# Altium project Deck Versal.PrjPcb
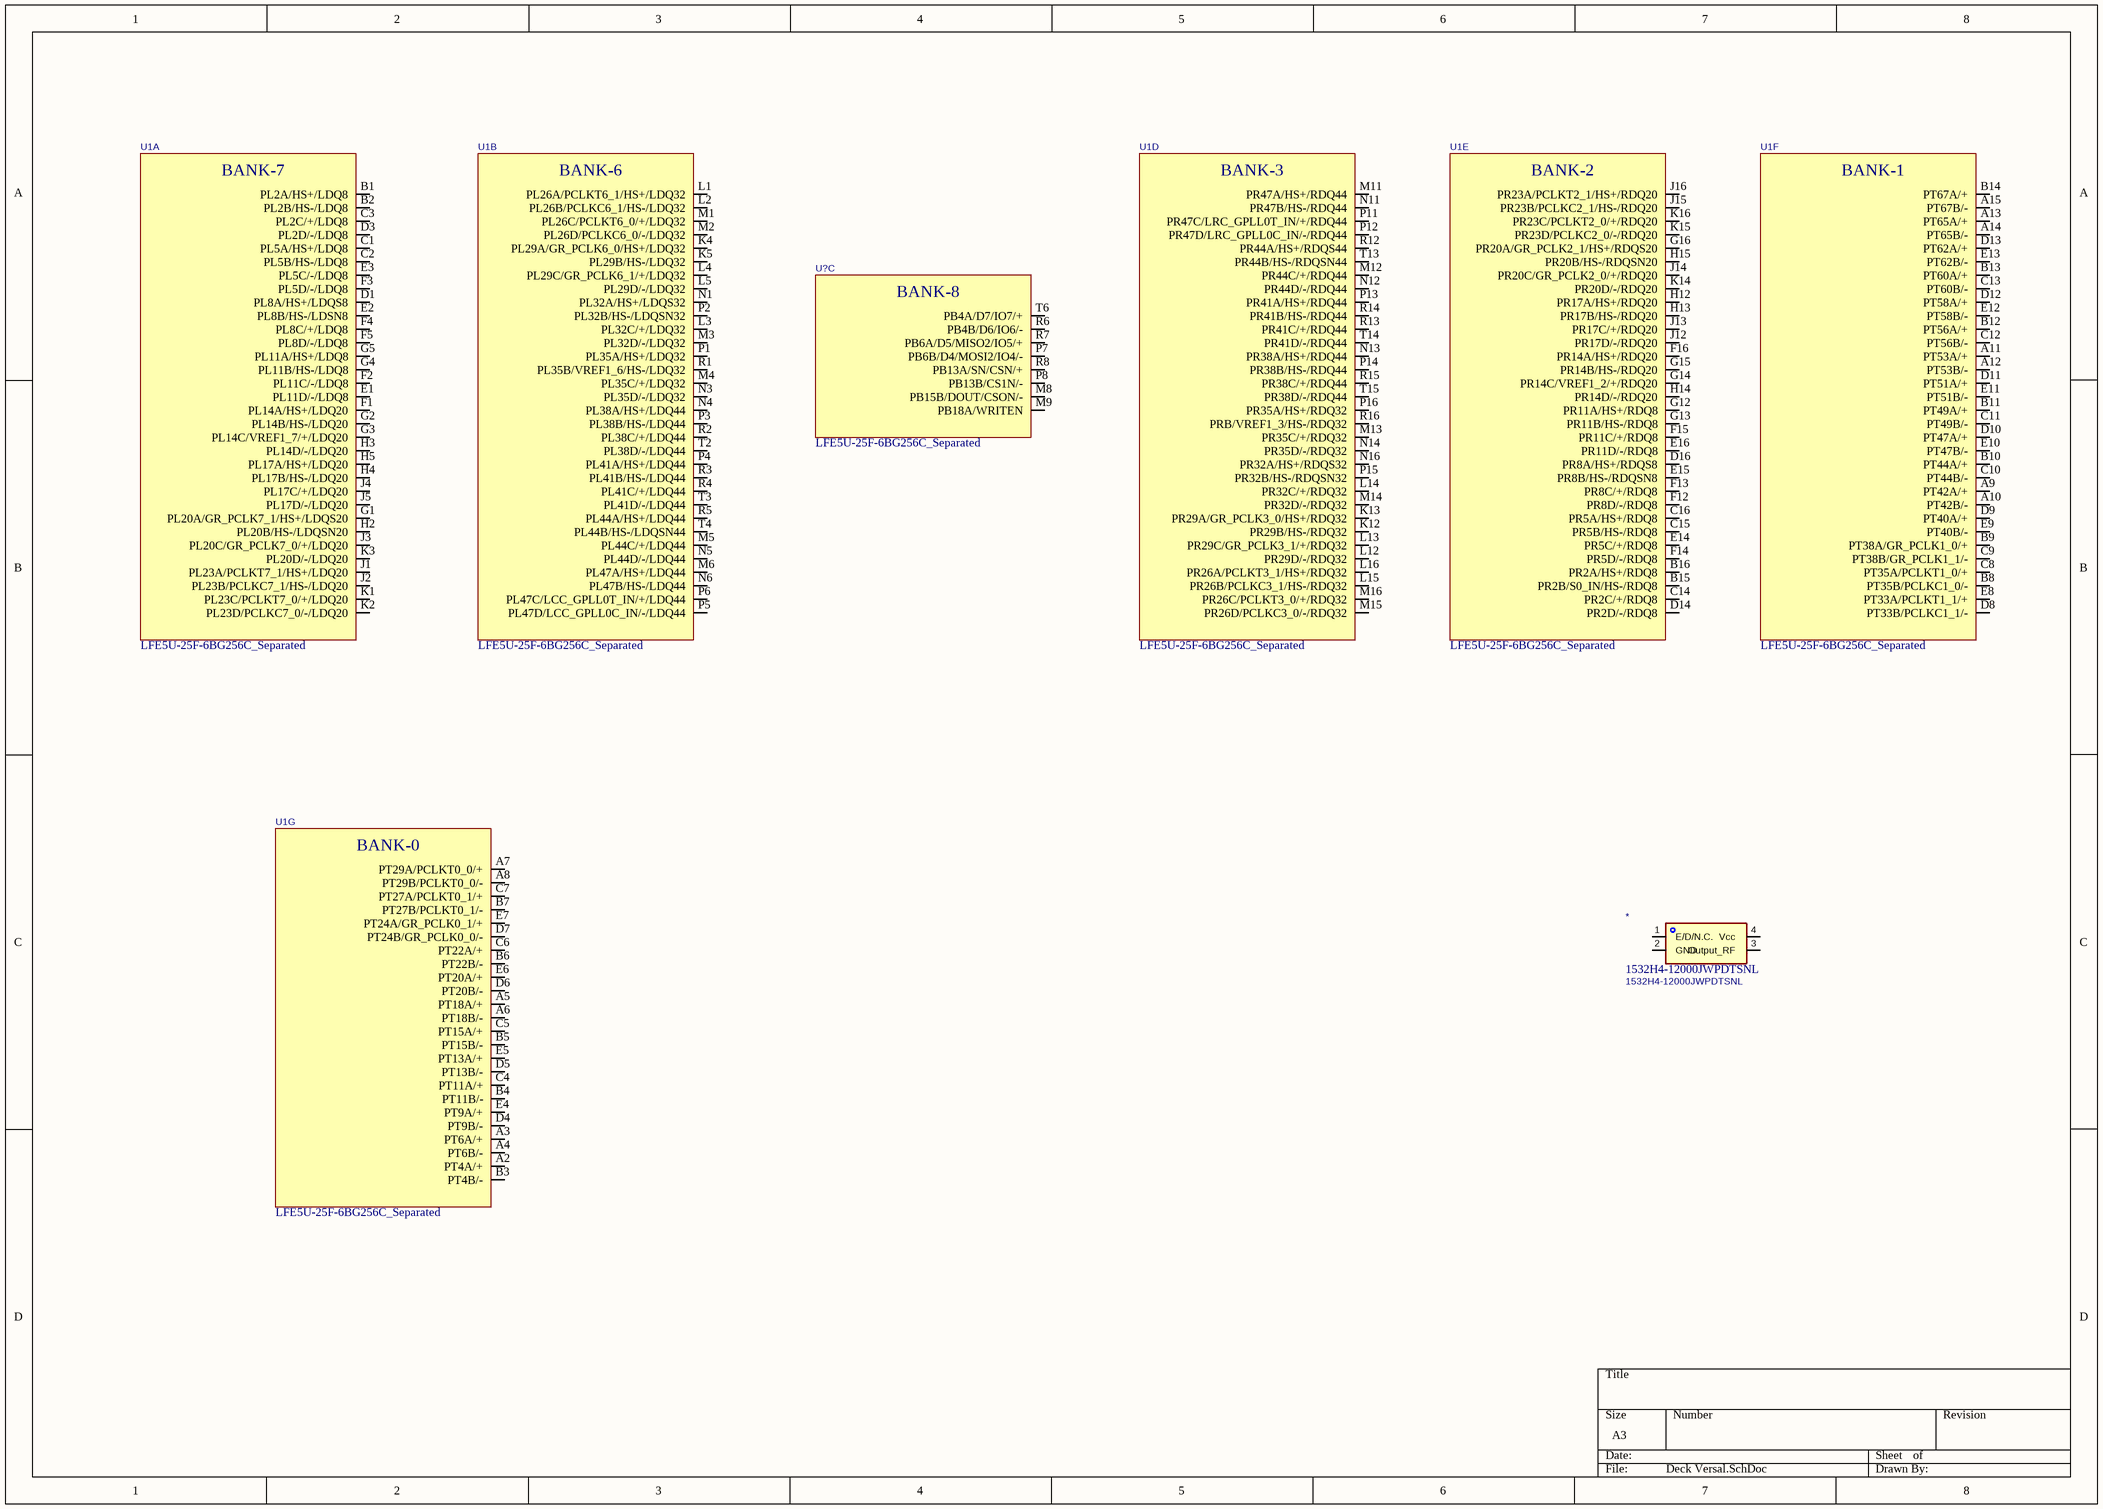
[diagram p0: Deck Versal.SchDoc]
5 sheets, 176 parts. Net scope: global (net labels, ports and power ports of the same name join across sheets).
Board file: Deck Versal.PcbDoc
Sheets:
  Deck Versal.SchDoc
  Keyboard.SchDoc
  Memory.SchDoc
  Peripherals.SchDoc
  Power.SchDoc

## Sheet Deck Versal.SchDoc
size A3

### Parts
(Parts that share a designator on the sheet are numbered #1, #2 ... from top to bottom, then left to right.)
*#1  1532H4-12000JWPDTSNL  [OSC-SMD_4P-L3.2-W2.5-BL]
U1  LFE5U-25F-6BG256C_Separated  [CABGA-256_L14.0-W14.0-R16-C16-P0.80-TL]  (parts A,B,D,E,F,G of 8)
U?  LFE5U-25F-6BG256C_Separated  [CABGA-256_L14.0-W14.0-R16-C16-P0.80-TL]  (part C of 8)

### Nets

Not connected (* = marked no-connect by the designer): *#1 1(E/D/N.C.) 2(GND) 3(Output_RF) 4(Vcc); U1 A2(PT4A/+) A3(PT6A/+) A4(PT6B/-) A5(PT18A/+) A6(PT18B/-) A7(PT29A/PCLKT0_0/+) A8(PT29B/PCLKT0_0/-) A9(PT42A/+) A10(PT42B/-) A11(PT53A/+) A12(PT53B/-) A13(PT65A/+) A14(PT65B/-) A15(PT67B/-) B1(PL2A/HS+/LDQ8) B2(PL2B/HS-/LDQ8) B3(PT4B/-) B4(PT11B/-) B5(PT15B/-) B6(PT22B/-) B7(PT27B/PCLKT0_1/-) B8(PT35B/PCLKC1_0/-) B9(PT38A/GR_PCLK1_0/+) B10(PT44A/+) B11(PT49A/+) B12(PT56A/+) B13(PT60A/+) B14(PT67A/+) B15(PR2B/S0_IN/HS-/RDQ8) B16(PR2A/HS+/RDQ8) C1(PL5A/HS+/LDQ8) C2(PL5B/HS-/LDQ8) C3(PL2C/+/LDQ8) C4(PT11A/+) C5(PT15A/+) C6(PT22A/+) C7(PT27A/PCLKT0_1/+) C8(PT35A/PCLKT1_0/+) C9(PT38B/GR_PCLK1_1/-) C10(PT44B/-) C11(PT49B/-) C12(PT56B/-) C13(PT60B/-) C14(PR2C/+/RDQ8) C15(PR5B/HS-/RDQ8) C16(PR5A/HS+/RDQ8) D1(PL8A/HS+/LDQS8) D3(PL2D/-/LDQ8) D4(PT9B/-) D5(PT13B/-) D6(PT20B/-) D7(PT24B/GR_PCLK0_0/-) D8(PT33B/PCLKC1_1/-) D9(PT40A/+) D10(PT47A/+) D11(PT51A/+) D12(PT58A/+) D13(PT62A/+) D14(PR2D/-/RDQ8) D16(PR8A/HS+/RDQS8) E1(PL11D/-/LDQ8) E2(PL8B/HS-/LDSN8) E3(PL5C/-/LDQ8) E4(PT9A/+) E5(PT13A/+) E6(PT20A/+) E7(PT24A/GR_PCLK0_1/+) E8(PT33A/PCLKT1_1/+) E9(PT40B/-) E10(PT47B/-) E11(PT51B/-) E12(PT58B/-) E13(PT62B/-) E14(PR5C/+/RDQ8) E15(PR8B/HS-/RDQSN8) E16(PR11D/-/RDQ8) F1(PL14A/HS+/LDQ20) F2(PL11C/-/LDQ8) F3(PL5D/-/LDQ8) F4(PL8C/+/LDQ8) F5(PL8D/-/LDQ8) F12(PR8D/-/RDQ8) F13(PR8C/+/RDQ8) F14(PR5D/-/RDQ8) F15(PR11C/+/RDQ8) F16(PR14A/HS+/RDQ20) G1(PL20A/GR_PCLK7_1/HS+/LDQS20) G2(PL14B/HS-/LDQ20) G3(PL14C/VREF1_7/+/LDQ20) G4(PL11B/HS-/LDQ8) G5(PL11A/HS+/LDQ8) G12(PR11A/HS+/RDQ8) G13(PR11B/HS-/RDQ8) G14(PR14C/VREF1_2/+/RDQ20) G15(PR14B/HS-/RDQ20) G16(PR20A/GR_PCLK2_1/HS+/RDQS20) H2(PL20B/HS-/LDQSN20) H3(PL14D/-/LDQ20) H4(PL17B/HS-/LDQ20) H5(PL17A/HS+/LDQ20) H12(PR17A/HS+/RDQ20) H13(PR17B/HS-/RDQ20) H14(PR14D/-/RDQ20) H15(PR20B/HS-/RDQSN20) J1(PL23A/PCLKT7_1/HS+/LDQ20) J2(PL23B/PCLKC7_1/HS-/LDQ20) J3(PL20C/GR_PCLK7_0/+/LDQ20) J4(PL17C/+/LDQ20) J5(PL17D/-/LDQ20) J12(PR17D/-/RDQ20) J13(PR17C/+/RDQ20) J14(PR20C/GR_PCLK2_0/+/RDQ20) J15(PR23B/PCLKC2_1/HS-/RDQ20) J16(PR23A/PCLKT2_1/HS+/RDQ20) K1(PL23C/PCLKT7_0/+/LDQ20) K2(PL23D/PCLKC7_0/-/LDQ20) K3(PL20D/-/LDQ20) K4(PL29A/GR_PCLK6_0/HS+/LDQ32) K5(PL29B/HS-/LDQ32) K12(PR29B/HS-/RDQ32) K13(PR29A/GR_PCLK3_0/HS+/RDQ32) K14(PR20D/-/RDQ20) K15(PR23D/PCLKC2_0/-/RDQ20) K16(PR23C/PCLKT2_0/+/RDQ20) L1(PL26A/PCLKT6_1/HS+/LDQ32) L2(PL26B/PCLKC6_1/HS-/LDQ32) L3(PL32C/+/LDQ32) L4(PL29C/GR_PCLK6_1/+/LDQ32) L5(PL29D/-/LDQ32) L12(PR29D/-/RDQ32) L13(PR29C/GR_PCLK3_1/+/RDQ32) L14(PR32C/+/RDQ32) L15(PR26B/PCLKC3_1/HS-/RDQ32) L16(PR26A/PCLKT3_1/HS+/RDQ32) M1(PL26C/PCLKT6_0/+/LDQ32) M2(PL26D/PCLKC6_0/-/LDQ32) M3(PL32D/-/LDQ32) M4(PL35C/+/LDQ32) M5(PL44C/+/LDQ44) M6(PL47A/HS+/LDQ44) M11(PR47A/HS+/RDQ44) M12(PR44C/+/RDQ44) M13(PR35C/+/RDQ32) M14(PR32D/-/RDQ32) M15(PR26D/PCLKC3_0/-/RDQ32) M16(PR26C/PCLKT3_0/+/RDQ32) N1(PL32A/HS+/LDQS32) N3(PL35D/-/LDQ32) N4(PL38A/HS+/LDQ44) N5(PL44D/-/LDQ44) N6(PL47B/HS-/LDQ44) N11(PR47B/HS-/RDQ44) N12(PR44D/-/RDQ44) N13(PR38A/HS+/RDQ44) N14(PR35D/-/RDQ32) N16(PR32A/HS+/RDQS32) P1(PL35A/HS+/LDQ32) P2(PL32B/HS-/LDQSN32) P3(PL38B/HS-/LDQ44) P4(PL41A/HS+/LDQ44) P5(PL47D/LCC_GPLL0C_IN/-/LDQ44) P6(PL47C/LCC_GPLL0T_IN/+/LDQ44) P11(PR47C/LRC_GPLL0T_IN/+/RDQ44) P12(PR47D/LRC_GPLL0C_IN/-/RDQ44) P13(PR41A/HS+/RDQ44) P14(PR38B/HS-/RDQ44) P15(PR32B/HS-/RDQSN32) P16(PR35A/HS+/RDQ32) R1(PL35B/VREF1_6/HS-/LDQ32) R2(PL38C/+/LDQ44) R3(PL41B/HS-/LDQ44) R4(PL41C/+/LDQ44) R5(PL44A/HS+/LDQ44) R12(PR44A/HS+/RDQS44) R13(PR41C/+/RDQ44) R14(PR41B/HS-/RDQ44) R15(PR38C/+/RDQ44) R16(PRB/VREF1_3/HS-/RDQ32) T2(PL38D/-/LDQ44) T3(PL41D/-/LDQ44) T4(PL44B/HS-/LDQSN44) T13(PR44B/HS-/RDQSN44) T14(PR41D/-/RDQ44) T15(PR38D/-/RDQ44); U? M8(PB15B/DOUT/CSON/-) M9(PB18A/WRITEN) P7(PB6B/D4/MOSI2/IO4/-) P8(PB13B/CS1N/-) R6(PB4B/D6/IO6/-) R7(PB6A/D5/MISO2/IO5/+) R8(PB13A/SN/CSN/+) T6(PB4A/D7/IO7/+)

### Notes on the sheet
- (in symbol LFE5U-25F-6BG256C_Separated, part A) BANK-7
- (in symbol LFE5U-25F-6BG256C_Separated, part B) BANK-6
- (in symbol LFE5U-25F-6BG256C_Separated, part C) BANK-8
- (in symbol LFE5U-25F-6BG256C_Separated, part D) BANK-3
- (in symbol LFE5U-25F-6BG256C_Separated, part E) BANK-2
- (in symbol LFE5U-25F-6BG256C_Separated, part F) BANK-1
- (in symbol LFE5U-25F-6BG256C_Separated, part G) BANK-0

### Library data of the parts
*#1 = 1532H4-12000JWPDTSNL: Manufacturer: HCI(杭晶); ki_keywords: Oscillators; Footprint: easyeda2kicad:OSC-SMD_4P-L3.2-W2.5-BL; Supplier: https://www.lcsc.com/datasheet/C5383163.pdf; MPN: 1532H4-12000JWPDTSNL; LCSC Part: C5383163; Value: 1532H4-12000JWPDTSNL
U1 U? = LFE5U-25F-6BG256C_Separated: Manufacturer: LATTICE(莱迪思); ki_keywords: CPLD/FPGA; Footprint: easyeda2kicad:CABGA-256_L14.0-W14.0-R16-C16-P0.80-TL; Supplier: https://www.lcsc.com/datasheet/C1521614.pdf; MPN: LFE5U-25F-6BG256C; LCSC Part: C1521614

## Sheet Keyboard.SchDoc
size C
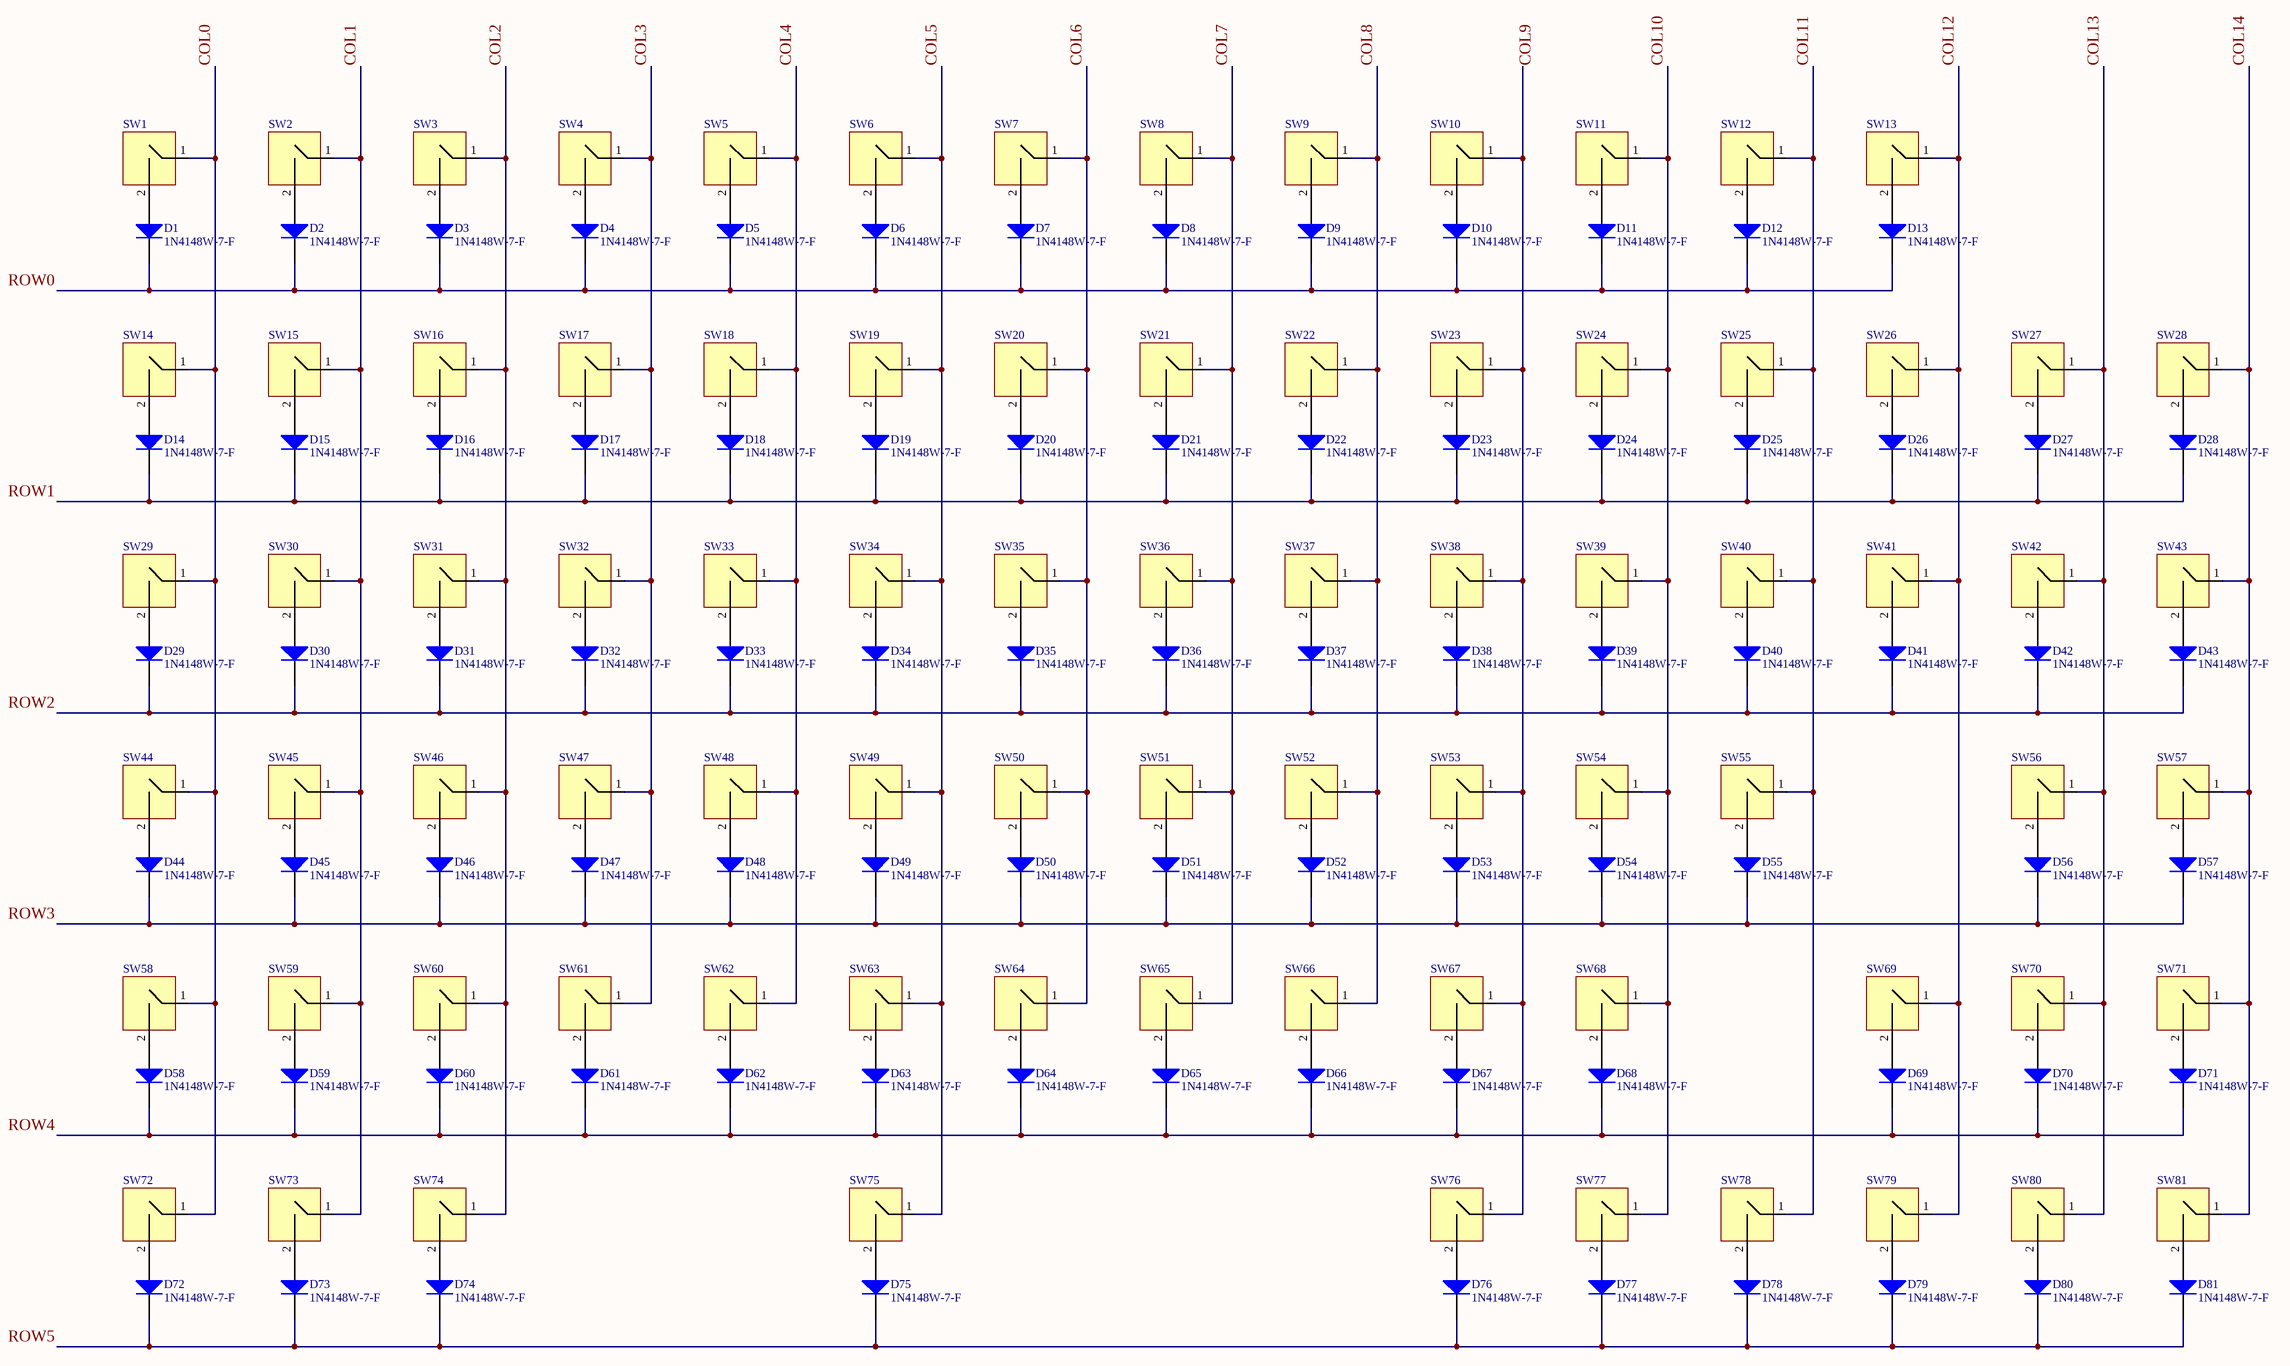
[diagram p1: Keyboard.SchDoc]

### Parts
D1  1N4148W-7-F  [DIOD-SOD123-2_V]
D2  1N4148W-7-F  [DIOD-SOD123-2_V]
D3  1N4148W-7-F  [DIOD-SOD123-2_V]
D4  1N4148W-7-F  [DIOD-SOD123-2_V]
D5  1N4148W-7-F  [DIOD-SOD123-2_V]
D6  1N4148W-7-F  [DIOD-SOD123-2_V]
D7  1N4148W-7-F  [DIOD-SOD123-2_V]
D8  1N4148W-7-F  [DIOD-SOD123-2_V]
D9  1N4148W-7-F  [DIOD-SOD123-2_V]
D10  1N4148W-7-F  [DIOD-SOD123-2_V]
D11  1N4148W-7-F  [DIOD-SOD123-2_V]
D12  1N4148W-7-F  [DIOD-SOD123-2_V]
D13  1N4148W-7-F  [DIOD-SOD123-2_V]
D14  1N4148W-7-F  [DIOD-SOD123-2_V]
D15  1N4148W-7-F  [DIOD-SOD123-2_V]
D16  1N4148W-7-F  [DIOD-SOD123-2_V]
D17  1N4148W-7-F  [DIOD-SOD123-2_V]
D18  1N4148W-7-F  [DIOD-SOD123-2_V]
D19  1N4148W-7-F  [DIOD-SOD123-2_V]
D20  1N4148W-7-F  [DIOD-SOD123-2_V]
D21  1N4148W-7-F  [DIOD-SOD123-2_V]
D22  1N4148W-7-F  [DIOD-SOD123-2_V]
D23  1N4148W-7-F  [DIOD-SOD123-2_V]
D24  1N4148W-7-F  [DIOD-SOD123-2_V]
D25  1N4148W-7-F  [DIOD-SOD123-2_V]
D26  1N4148W-7-F  [DIOD-SOD123-2_V]
D27  1N4148W-7-F  [DIOD-SOD123-2_V]
D28  1N4148W-7-F  [DIOD-SOD123-2_V]
D29  1N4148W-7-F  [DIOD-SOD123-2_V]
D30  1N4148W-7-F  [DIOD-SOD123-2_V]
D31  1N4148W-7-F  [DIOD-SOD123-2_V]
D32  1N4148W-7-F  [DIOD-SOD123-2_V]
D33  1N4148W-7-F  [DIOD-SOD123-2_V]
D34  1N4148W-7-F  [DIOD-SOD123-2_V]
D35  1N4148W-7-F  [DIOD-SOD123-2_V]
D36  1N4148W-7-F  [DIOD-SOD123-2_V]
D37  1N4148W-7-F  [DIOD-SOD123-2_V]
D38  1N4148W-7-F  [DIOD-SOD123-2_V]
D39  1N4148W-7-F  [DIOD-SOD123-2_V]
D40  1N4148W-7-F  [DIOD-SOD123-2_V]
D41  1N4148W-7-F  [DIOD-SOD123-2_V]
D42  1N4148W-7-F  [DIOD-SOD123-2_V]
D43  1N4148W-7-F  [DIOD-SOD123-2_V]
D44  1N4148W-7-F  [DIOD-SOD123-2_V]
D45  1N4148W-7-F  [DIOD-SOD123-2_V]
D46  1N4148W-7-F  [DIOD-SOD123-2_V]
D47  1N4148W-7-F  [DIOD-SOD123-2_V]
D48  1N4148W-7-F  [DIOD-SOD123-2_V]
D49  1N4148W-7-F  [DIOD-SOD123-2_V]
D50  1N4148W-7-F  [DIOD-SOD123-2_V]
D51  1N4148W-7-F  [DIOD-SOD123-2_V]
D52  1N4148W-7-F  [DIOD-SOD123-2_V]
D53  1N4148W-7-F  [DIOD-SOD123-2_V]
D54  1N4148W-7-F  [DIOD-SOD123-2_V]
D55  1N4148W-7-F  [DIOD-SOD123-2_V]
D56  1N4148W-7-F  [DIOD-SOD123-2_V]
D57  1N4148W-7-F  [DIOD-SOD123-2_V]
D58  1N4148W-7-F  [DIOD-SOD123-2_V]
D59  1N4148W-7-F  [DIOD-SOD123-2_V]
D60  1N4148W-7-F  [DIOD-SOD123-2_V]
D61  1N4148W-7-F  [DIOD-SOD123-2_V]
D62  1N4148W-7-F  [DIOD-SOD123-2_V]
D63  1N4148W-7-F  [DIOD-SOD123-2_V]
D64  1N4148W-7-F  [DIOD-SOD123-2_V]
D65  1N4148W-7-F  [DIOD-SOD123-2_V]
D66  1N4148W-7-F  [DIOD-SOD123-2_V]
D67  1N4148W-7-F  [DIOD-SOD123-2_V]
D68  1N4148W-7-F  [DIOD-SOD123-2_V]
D69  1N4148W-7-F  [DIOD-SOD123-2_V]
D70  1N4148W-7-F  [DIOD-SOD123-2_V]
D71  1N4148W-7-F  [DIOD-SOD123-2_V]
D72  1N4148W-7-F  [DIOD-SOD123-2_V]
D73  1N4148W-7-F  [DIOD-SOD123-2_V]
D74  1N4148W-7-F  [DIOD-SOD123-2_V]
D75  1N4148W-7-F  [DIOD-SOD123-2_V]
D76  1N4148W-7-F  [DIOD-SOD123-2_V]
D77  1N4148W-7-F  [DIOD-SOD123-2_V]
D78  1N4148W-7-F  [DIOD-SOD123-2_V]
D79  1N4148W-7-F  [DIOD-SOD123-2_V]
D80  1N4148W-7-F  [DIOD-SOD123-2_V]
D81  1N4148W-7-F  [DIOD-SOD123-2_V]
SW1  Outemu_Switch  [SW_Cherry_MX_PCB_1.00u]  (value not drawn)
SW2  Outemu_Switch  [SW_Cherry_MX_PCB_1.00u]  (value not drawn)
SW3  Outemu_Switch  [SW_Cherry_MX_PCB_1.00u]  (value not drawn)
SW4  Outemu_Switch  [SW_Cherry_MX_PCB_1.00u]  (value not drawn)
SW5  Outemu_Switch  [SW_Cherry_MX_PCB_1.00u]  (value not drawn)
SW6  Outemu_Switch  [SW_Cherry_MX_PCB_1.00u]  (value not drawn)
SW7  Outemu_Switch  [SW_Cherry_MX_PCB_1.00u]  (value not drawn)
SW8  Outemu_Switch  [SW_Cherry_MX_PCB_1.00u]  (value not drawn)
SW9  Outemu_Switch  [SW_Cherry_MX_PCB_1.00u]  (value not drawn)
SW10  Outemu_Switch  [SW_Cherry_MX_PCB_1.00u]  (value not drawn)
SW11  Outemu_Switch  [SW_Cherry_MX_PCB_1.00u]  (value not drawn)
SW12  Outemu_Switch  [SW_Cherry_MX_PCB_1.00u]  (value not drawn)
SW13  Outemu_Switch  [SW_Cherry_MX_PCB_1.00u]  (value not drawn)
SW14  Outemu_Switch  [SW_Cherry_MX_PCB_1.00u]  (value not drawn)
SW15  Outemu_Switch  [SW_Cherry_MX_PCB_1.00u]  (value not drawn)
SW16  Outemu_Switch  [SW_Cherry_MX_PCB_1.00u]  (value not drawn)
SW17  Outemu_Switch  [SW_Cherry_MX_PCB_1.00u]  (value not drawn)
SW18  Outemu_Switch  [SW_Cherry_MX_PCB_1.00u]  (value not drawn)
SW19  Outemu_Switch  [SW_Cherry_MX_PCB_1.00u]  (value not drawn)
SW20  Outemu_Switch  [SW_Cherry_MX_PCB_1.00u]  (value not drawn)
SW21  Outemu_Switch  [SW_Cherry_MX_PCB_1.00u]  (value not drawn)
SW22  Outemu_Switch  [SW_Cherry_MX_PCB_1.00u]  (value not drawn)
SW23  Outemu_Switch  [SW_Cherry_MX_PCB_1.00u]  (value not drawn)
SW24  Outemu_Switch  [SW_Cherry_MX_PCB_1.00u]  (value not drawn)
SW25  Outemu_Switch  [SW_Cherry_MX_PCB_1.00u]  (value not drawn)
SW26  Outemu_Switch  [SW_Cherry_MX_PCB_1.00u]  (value not drawn)
SW27  Outemu_Switch  [SW_Cherry_MX_PCB_1.00u]  (value not drawn)
SW28  Outemu_Switch  [SW_Cherry_MX_PCB_1.00u]  (value not drawn)
SW29  Outemu_Switch  [SW_Cherry_MX_PCB_1.00u]  (value not drawn)
SW30  Outemu_Switch  [SW_Cherry_MX_PCB_1.00u]  (value not drawn)
SW31  Outemu_Switch  [SW_Cherry_MX_PCB_1.00u]  (value not drawn)
SW32  Outemu_Switch  [SW_Cherry_MX_PCB_1.00u]  (value not drawn)
SW33  Outemu_Switch  [SW_Cherry_MX_PCB_1.00u]  (value not drawn)
SW34  Outemu_Switch  [SW_Cherry_MX_PCB_1.00u]  (value not drawn)
SW35  Outemu_Switch  [SW_Cherry_MX_PCB_1.00u]  (value not drawn)
SW36  Outemu_Switch  [SW_Cherry_MX_PCB_1.00u]  (value not drawn)
SW37  Outemu_Switch  [SW_Cherry_MX_PCB_1.00u]  (value not drawn)
SW38  Outemu_Switch  [SW_Cherry_MX_PCB_1.00u]  (value not drawn)
SW39  Outemu_Switch  [SW_Cherry_MX_PCB_1.00u]  (value not drawn)
SW40  Outemu_Switch  [SW_Cherry_MX_PCB_1.00u]  (value not drawn)
SW41  Outemu_Switch  [SW_Cherry_MX_PCB_1.00u]  (value not drawn)
SW42  Outemu_Switch  [SW_Cherry_MX_PCB_1.00u]  (value not drawn)
SW43  Outemu_Switch  [SW_Cherry_MX_PCB_1.00u]  (value not drawn)
SW44  Outemu_Switch  [SW_Cherry_MX_PCB_1.00u]  (value not drawn)
SW45  Outemu_Switch  [SW_Cherry_MX_PCB_1.00u]  (value not drawn)
SW46  Outemu_Switch  [SW_Cherry_MX_PCB_1.00u]  (value not drawn)
SW47  Outemu_Switch  [SW_Cherry_MX_PCB_1.00u]  (value not drawn)
SW48  Outemu_Switch  [SW_Cherry_MX_PCB_1.00u]  (value not drawn)
SW49  Outemu_Switch  [SW_Cherry_MX_PCB_1.00u]  (value not drawn)
SW50  Outemu_Switch  [SW_Cherry_MX_PCB_1.00u]  (value not drawn)
SW51  Outemu_Switch  [SW_Cherry_MX_PCB_1.00u]  (value not drawn)
SW52  Outemu_Switch  [SW_Cherry_MX_PCB_1.00u]  (value not drawn)
SW53  Outemu_Switch  [SW_Cherry_MX_PCB_1.00u]  (value not drawn)
SW54  Outemu_Switch  [SW_Cherry_MX_PCB_1.00u]  (value not drawn)
SW55  Outemu_Switch  [SW_Cherry_MX_PCB_1.00u]  (value not drawn)
SW56  Outemu_Switch  [SW_Cherry_MX_PCB_1.00u]  (value not drawn)
SW57  Outemu_Switch  [SW_Cherry_MX_PCB_1.00u]  (value not drawn)
SW58  Outemu_Switch  [SW_Cherry_MX_PCB_1.00u]  (value not drawn)
SW59  Outemu_Switch  [SW_Cherry_MX_PCB_1.00u]  (value not drawn)
SW60  Outemu_Switch  [SW_Cherry_MX_PCB_1.00u]  (value not drawn)
SW61  Outemu_Switch  [SW_Cherry_MX_PCB_1.00u]  (value not drawn)
SW62  Outemu_Switch  [SW_Cherry_MX_PCB_1.00u]  (value not drawn)
SW63  Outemu_Switch  [SW_Cherry_MX_PCB_1.00u]  (value not drawn)
SW64  Outemu_Switch  [SW_Cherry_MX_PCB_1.00u]  (value not drawn)
SW65  Outemu_Switch  [SW_Cherry_MX_PCB_1.00u]  (value not drawn)
SW66  Outemu_Switch  [SW_Cherry_MX_PCB_1.00u]  (value not drawn)
SW67  Outemu_Switch  [SW_Cherry_MX_PCB_1.00u]  (value not drawn)
SW68  Outemu_Switch  [SW_Cherry_MX_PCB_1.00u]  (value not drawn)
SW69  Outemu_Switch  [SW_Cherry_MX_PCB_1.00u]  (value not drawn)
SW70  Outemu_Switch  [SW_Cherry_MX_PCB_1.00u]  (value not drawn)
SW71  Outemu_Switch  [SW_Cherry_MX_PCB_1.00u]  (value not drawn)
SW72  Outemu_Switch  [SW_Cherry_MX_PCB_1.00u]  (value not drawn)
SW73  Outemu_Switch  [SW_Cherry_MX_PCB_1.00u]  (value not drawn)
SW74  Outemu_Switch  [SW_Cherry_MX_PCB_1.00u]  (value not drawn)
SW75  Outemu_Switch  [SW_Cherry_MX_PCB_1.00u]  (value not drawn)
SW76  Outemu_Switch  [SW_Cherry_MX_PCB_1.00u]  (value not drawn)
SW77  Outemu_Switch  [SW_Cherry_MX_PCB_1.00u]  (value not drawn)
SW78  Outemu_Switch  [SW_Cherry_MX_PCB_1.00u]  (value not drawn)
SW79  Outemu_Switch  [SW_Cherry_MX_PCB_1.00u]  (value not drawn)
SW80  Outemu_Switch  [SW_Cherry_MX_PCB_1.00u]  (value not drawn)
SW81  Outemu_Switch  [SW_Cherry_MX_PCB_1.00u]  (value not drawn)

### Nets
COL0: SW1.1 SW14.1 SW29.1 SW44.1 SW58.1 SW72.1
COL1: SW2.1 SW15.1 SW30.1 SW45.1 SW59.1 SW73.1
COL2: SW3.1 SW16.1 SW31.1 SW46.1 SW60.1 SW74.1
COL3: SW4.1 SW17.1 SW32.1 SW47.1 SW61.1
COL4: SW5.1 SW18.1 SW33.1 SW48.1 SW62.1
COL5: SW6.1 SW19.1 SW34.1 SW49.1 SW63.1 SW75.1
COL6: SW7.1 SW20.1 SW35.1 SW50.1 SW64.1
COL7: SW8.1 SW21.1 SW36.1 SW51.1 SW65.1
COL8: SW9.1 SW22.1 SW37.1 SW52.1 SW66.1
COL10: SW11.1 SW24.1 SW39.1 SW54.1 SW68.1 SW77.1
COL11: SW12.1 SW25.1 SW40.1 SW55.1 SW78.1
COL12: SW13.1 SW26.1 SW41.1 SW69.1 SW79.1
COL13: SW27.1 SW42.1 SW56.1 SW70.1 SW80.1
COL14: SW28.1 SW43.1 SW57.1 SW71.1 SW81.1
ROW0: D1.2(K) D2.2(K) D3.2(K) D4.2(K) D5.2(K) D6.2(K) D7.2(K) D8.2(K) D9.2(K) D10.2(K) D11.2(K) D12.2(K) D13.2(K)
ROW1: D14.2(K) D15.2(K) D16.2(K) D17.2(K) D18.2(K) D19.2(K) D20.2(K) D21.2(K) D22.2(K) D23.2(K) D24.2(K) D25.2(K) D26.2(K) D27.2(K) D28.2(K)
ROW2: D29.2(K) D30.2(K) D31.2(K) D32.2(K) D33.2(K) D34.2(K) D35.2(K) D36.2(K) D37.2(K) D38.2(K) D39.2(K) D40.2(K) D41.2(K) D42.2(K) D43.2(K)
ROW3: D44.2(K) D45.2(K) D46.2(K) D47.2(K) D48.2(K) D49.2(K) D50.2(K) D51.2(K) D52.2(K) D53.2(K) D54.2(K) D55.2(K) D56.2(K) D57.2(K)
ROW4: D58.2(K) D59.2(K) D60.2(K) D61.2(K) D62.2(K) D63.2(K) D64.2(K) D65.2(K) D66.2(K) D67.2(K) D68.2(K) D69.2(K) D70.2(K) D71.2(K)
ROW5: D72.2(K) D73.2(K) D74.2(K) D75.2(K) D76.2(K) D77.2(K) D78.2(K) D79.2(K) D80.2(K) D81.2(K)
NetD1_1: D1.1(A) SW1.2
NetD2_1: D2.1(A) SW2.2
NetD3_1: D3.1(A) SW3.2
NetD4_1: D4.1(A) SW4.2
NetD5_1: D5.1(A) SW5.2
NetD6_1: D6.1(A) SW6.2
NetD7_1: D7.1(A) SW7.2
NetD8_1: D8.1(A) SW8.2
NetD9_1: D9.1(A) SW9.2
NetD10_1: D10.1(A) SW10.2
NetD11_1: D11.1(A) SW11.2
NetD12_1: D12.1(A) SW12.2
NetD13_1: D13.1(A) SW13.2
NetD14_1: D14.1(A) SW14.2
NetD15_1: D15.1(A) SW15.2
NetD16_1: D16.1(A) SW16.2
NetD17_1: D17.1(A) SW17.2
NetD18_1: D18.1(A) SW18.2
NetD19_1: D19.1(A) SW19.2
NetD20_1: D20.1(A) SW20.2
NetD21_1: D21.1(A) SW21.2
NetD22_1: D22.1(A) SW22.2
NetD23_1: D23.1(A) SW23.2
NetD24_1: D24.1(A) SW24.2
NetD25_1: D25.1(A) SW25.2
NetD26_1: D26.1(A) SW26.2
NetD27_1: D27.1(A) SW27.2
NetD28_1: D28.1(A) SW28.2
NetD29_1: D29.1(A) SW29.2
NetD30_1: D30.1(A) SW30.2
NetD31_1: D31.1(A) SW31.2
NetD32_1: D32.1(A) SW32.2
NetD33_1: D33.1(A) SW33.2
NetD34_1: D34.1(A) SW34.2
NetD35_1: D35.1(A) SW35.2
NetD36_1: D36.1(A) SW36.2
NetD37_1: D37.1(A) SW37.2
NetD38_1: D38.1(A) SW38.2
NetD39_1: D39.1(A) SW39.2
NetD40_1: D40.1(A) SW40.2
NetD41_1: D41.1(A) SW41.2
NetD42_1: D42.1(A) SW42.2
NetD43_1: D43.1(A) SW43.2
NetD44_1: D44.1(A) SW44.2
NetD45_1: D45.1(A) SW45.2
NetD46_1: D46.1(A) SW46.2
NetD47_1: D47.1(A) SW47.2
NetD48_1: D48.1(A) SW48.2
NetD49_1: D49.1(A) SW49.2
NetD50_1: D50.1(A) SW50.2
NetD51_1: D51.1(A) SW51.2
NetD52_1: D52.1(A) SW52.2
NetD53_1: D53.1(A) SW53.2
NetD54_1: D54.1(A) SW54.2
NetD55_1: D55.1(A) SW55.2
NetD56_1: D56.1(A) SW56.2
NetD57_1: D57.1(A) SW57.2
NetD58_1: D58.1(A) SW58.2
NetD59_1: D59.1(A) SW59.2
NetD60_1: D60.1(A) SW60.2
NetD61_1: D61.1(A) SW61.2
NetD62_1: D62.1(A) SW62.2
NetD63_1: D63.1(A) SW63.2
NetD64_1: D64.1(A) SW64.2
NetD65_1: D65.1(A) SW65.2
NetD66_1: D66.1(A) SW66.2
NetD67_1: D67.1(A) SW67.2
NetD68_1: D68.1(A) SW68.2
NetD69_1: D69.1(A) SW69.2
NetD70_1: D70.1(A) SW70.2
NetD71_1: D71.1(A) SW71.2
NetD72_1: D72.1(A) SW72.2
NetD73_1: D73.1(A) SW73.2
NetD74_1: D74.1(A) SW74.2
NetD75_1: D75.1(A) SW75.2
NetD76_1: D76.1(A) SW76.2
NetD77_1: D77.1(A) SW77.2
NetD78_1: D78.1(A) SW78.2
NetD79_1: D79.1(A) SW79.2
NetD80_1: D80.1(A) SW80.2
NetD81_1: D81.1(A) SW81.2
NetSW10_1: SW10.1 SW23.1 SW38.1 SW53.1 SW67.1 SW76.1

### Notes on the sheet
- Labels drawn without touching a wire or pin: COL9

### Library data of the parts
D1-D81 = CMP-2000-04932-2: Fast Switching Diode, 100 V, 0.15 A, -65 to 150 degC, 2-Pin?SOD123, RoHS, Tape and Reel; Recovery Time: 4ns; Brand: DiodesIncorporated; Unit Weight: 0.000353oz; Max Surge Current: 2A; Peak Reverse Voltage: 100V; Ir - Reverse Current: 1uA; Vf - Forward Voltage: 1.25V; Configuration: Single; If - Forward Current: 0.15A; Product Category: Diodes-GeneralPurpose,Power,Switching; Operating Temperature Range: -65Cto+150C; Packaging: Reel; Manufacturer URL: http://www.diodes.com/; Maximum Operating Temperature: +150C; Height: 1.25mm; Minimum Operating Temperature: -65C; Product: SwitchingDiodes; Package URL: http://www.diodes.com/datasheets/ds18004.pdf; Type: SwitchingDiode; Package Reference: SOD123-2; Width: 1.7mm; Datasheet URL: http://www.farnell.com/datasheets/1915529.pdf; Datasheet Version: Rev. 24-2, 10/2013; Series: 1N4148; Factory Pack Quantity: 3000; Length: 2.85mm; RoHS: True; Manufacturer: DiodesIncorporated; Mounting Style: SMD/SMT; Package / Case: SOD-123

## Sheet Memory.SchDoc
size A4
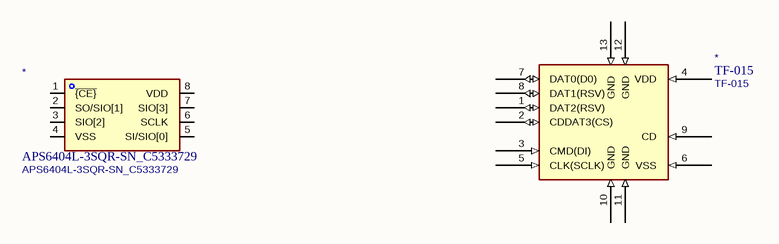
[diagram p2: Memory.SchDoc]

### Parts
(Parts that share a designator on the sheet are numbered #1, #2 ... from top to bottom, then left to right.)
*#2  APS6404L-3SQR-SN_C5333729  [SOIC-8_L4.9-W3.9-P1.27-LS6.0-BL]
*#3  TF-015  [TF-SMD_TF-015]

### Nets

Not connected (* = marked no-connect by the designer): *#2 1(~{{CE}}) 2(SO/SIO[1]) 3(SIO[2]) 4(VSS) 5(SI/SIO[0]) 6(SCLK) 7(SIO[3]) 8(VDD); *#3 1(DAT2(RSV)) 2(CDDAT3(CS)) 3(CMD(DI)) 4(VDD) 5(CLK(SCLK)) 6(VSS) 7(DAT0(D0)) 8(DAT1(RSV)) 9(CD) 10(GND) 11(GND) 12(GND) 13(GND)

### Library data of the parts
*#2 = APS6404L-3SQR-SN_C5333729: Manufacturer: Apmemory; ki_keywords: DRAM; Footprint: easyeda2kicad:SOIC-8_L4.9-W3.9-P1.27-LS6.0-BL; Supplier: https://www.lcsc.com/datasheet/C5333729.pdf; MPN: APS6404L-3SQR-SN; LCSC Part: C5333729; Value: APS6404L-3SQR-SN_C5333729
*#3 = TF-015: Manufacturer: SOFNG(硕方); ki_keywords: SIM Card Connectors; Footprint: easyeda2kicad:TF-SMD_TF-015; Supplier: https://lcsc.com/product-detail/Card-Sockets_TF-015_C113206.html; MPN: TF-015; LCSC Part: C113206; Value: TF-015

## Sheet Peripherals.SchDoc
size A4
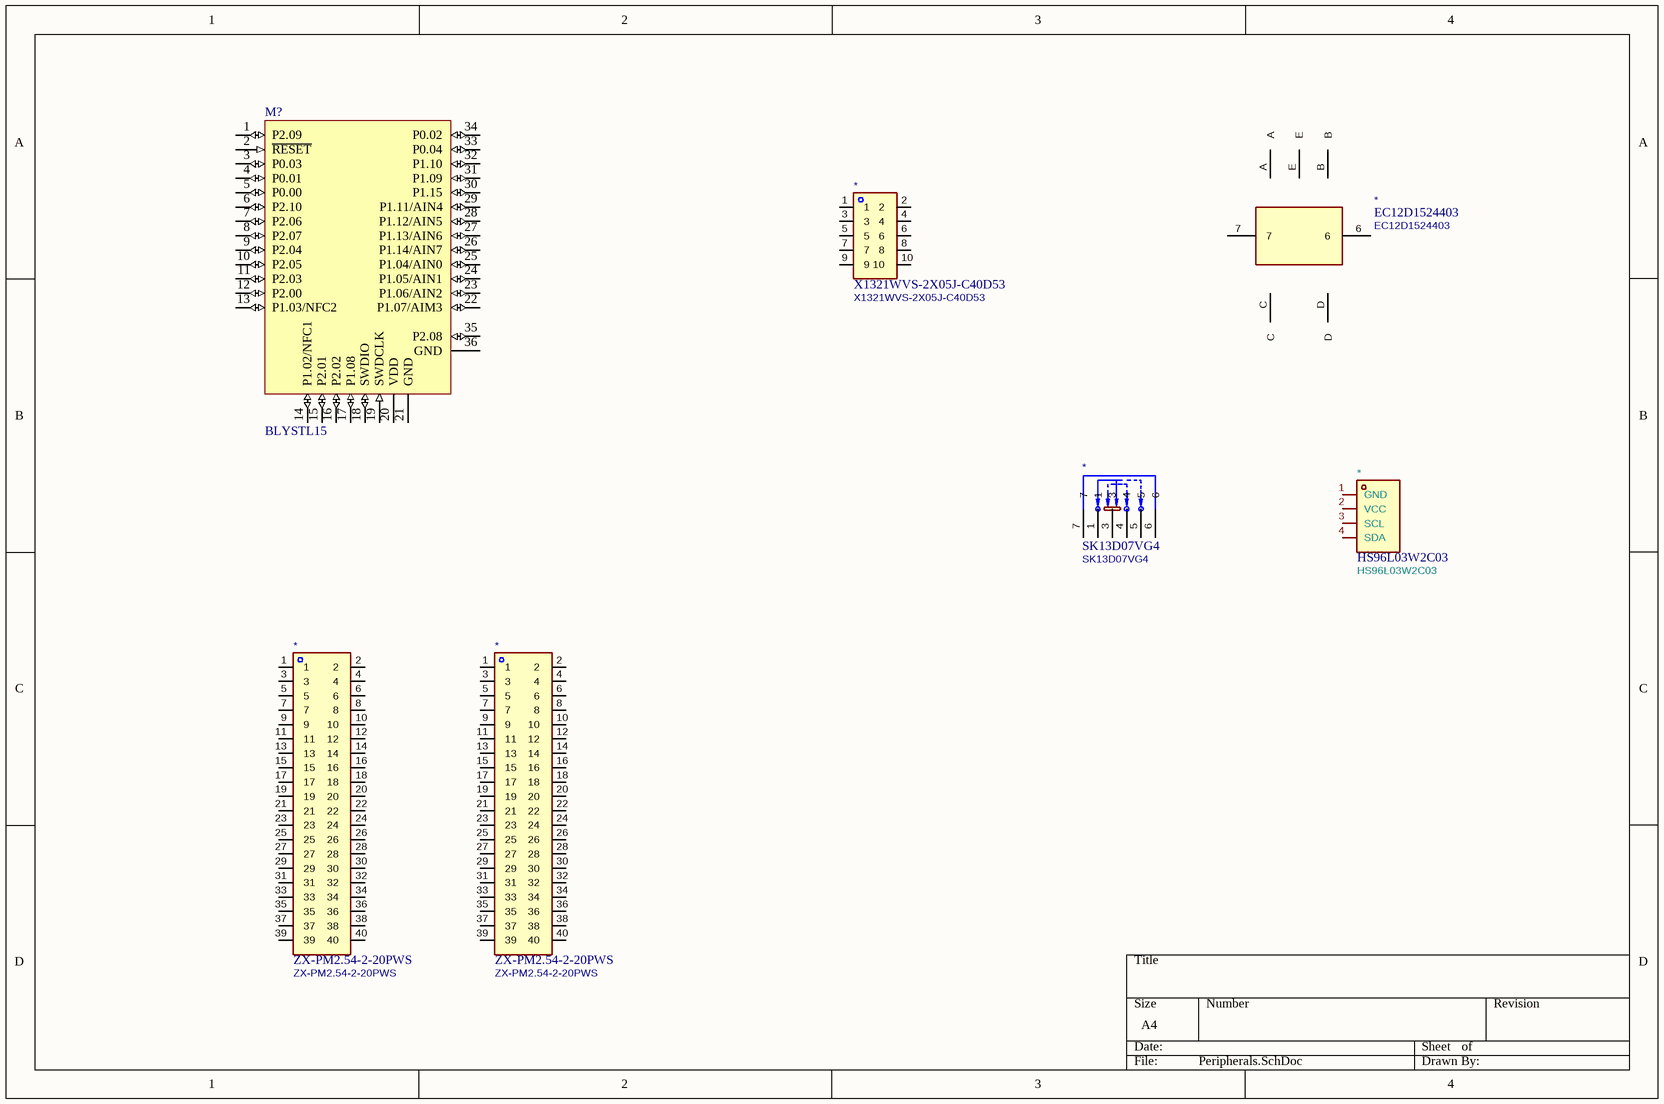
[diagram p3: Peripherals.SchDoc]

### Parts
(Parts that share a designator on the sheet are numbered #1, #2 ... from top to bottom, then left to right.)
*#4  X1321WVS-2X05J-C40D53  [HDR-SMD_10P-P1.27-V-M-C2-C5-LS5.3]
*#5  EC12D1524403  [SW-TH_EC12D1524403]
*#6  SK13D07VG4  [SW-TH_SK13D07VG4]
*#7  HS96L03W2C03  [OLED-TH_L27.8-W27.2-P2.54_C9900033791]
*#8  ZX-PM2.54-2-20PWS  [HDR-TH_40P-P2.54-H-F-R2-C20-S2.54-W8.5_1]
*#9  ZX-PM2.54-2-20PWS  [HDR-TH_40P-P2.54-H-F-R2-C20-S2.54-W8.5_1]
M?  BLYSTL15  [BLYSTL15]

### Nets

Not connected (* = marked no-connect by the designer): *#4 1 2 3 4 5 6 7 8 9 10; *#5 6 7 A B C D E; *#6 1 3 4 5 6 7; *#7 1(GND) 2(VCC) 3(SCL) 4(SDA); *#8 1 2 3 4 5 6 7 8 9 10 11 12 13 14 15 16 17 18 19 20 21 22 23 24 25 26 27 28 29 30 31 32 33 34 35 36 37 38 39 40; *#9 1 2 3 4 5 6 7 8 9 10 11 12 13 14 15 16 17 18 19 20 21 22 23 24 25 26 27 28 29 30 31 32 33 34 35 36 37 38 39 40; M? 1(P2.09) 2(~{RESET}) 3(P0.03) 4(P0.01) 5(P0.00) 6(P2.10) 7(P2.06) 8(P2.07) 9(P2.04) 10(P2.05) 11(P2.03) 12(P2.00) 13(P1.03/NFC2) 14(P1.02/NFC1) 15(P2.01) 16(P2.02) 17(P1.08) 18(SWDIO) 19(SWDCLK) 20(VDD) 21(GND) 22(P1.07/AIM3) 23(P1.06/AIN2) 24(P1.05/AIN1) 25(P1.04/AIN0) 26(P1.14/AIN7) 27(P1.13/AIN6) 28(P1.12/AIN5) 29(P1.11/AIN4) 30(P1.15) 31(P1.09) 32(P1.10) 33(P0.04) 34(P0.02) 35(P2.08) 36(GND)

### Library data of the parts
*#4 = X1321WVS-2X05J-C40D53: Manufacturer: XKB Connection(中国星坤); ki_keywords: Pin Headers; Footprint: easyeda2kicad:HDR-SMD_10P-P1.27-V-M-C2-C5-LS5.3; Supplier: https://www.lcsc.com/datasheet/C2881910.pdf; MPN: X1321WVS-2x05J-C40D53; LCSC Part: C2881910; Value: X1321WVS-2X05J-C40D53
*#5 = EC12D1524403: Manufacturer: ALPSALPINE(阿尔卑斯阿尔派); ki_keywords: Rotary Encoders; Footprint: easyeda2kicad:SW-TH_EC12D1524403; Supplier: https://lcsc.com/product-detail/Coded-Rotary-Switches_ALPS_EC12D1524403_EC12D1524403_C112349.html; MPN: EC12D1524403; LCSC Part: C112349; Value: EC12D1524403
*#6 = SK13D07VG4: Manufacturer: SHOU HAN(首韩); ki_keywords: Slide Switches; Footprint: easyeda2kicad:SW-TH_SK13D07VG4; Supplier: https://www.lcsc.com/datasheet/C2681581.pdf; MPN: SK13D07VG4; LCSC Part: C2681581; Value: SK13D07VG4
*#7 = HS96L03W2C03: Manufacturer: HS(汉昇); ki_keywords: OLED Displays Modules; Footprint: easyeda2kicad:OLED-TH_L27.8-W27.2-P2.54_C9900033791; Supplier: https://www.lcsc.com/datasheet/C5248080.pdf; MPN: HS96L03W2C03; LCSC Part: C5248080; Value: HS96L03W2C03
*#8 *#9 = ZX-PM2.54-2-20PWS: Manufacturer: Megastar(兆星); Footprint: easyeda2kicad:HDR-TH_40P-P2.54-H-F-R2-C20-S2.54-W8.5_1; Supplier: https://www.lcsc.com/datasheet/C49326201.pdf; MPN: ZX-PM2.54-2-20PWS; LCSC Part: C49326201; Value: ZX-PM2.54-2-20PWS
M? = BLYSTL15: Nordic  nRF54L15 - BLE module

## Sheet Power.SchDoc
size A3
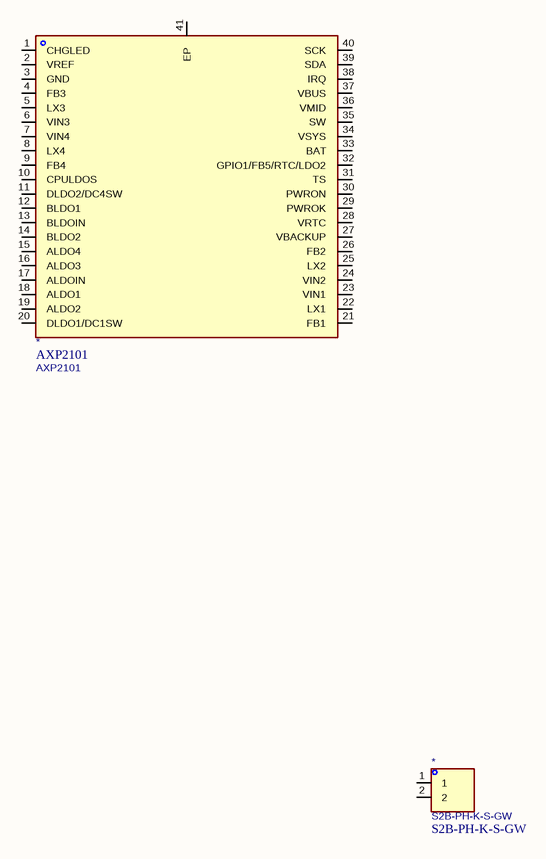
[diagram p4: Power.SchDoc]

### Parts
(Parts that share a designator on the sheet are numbered #1, #2 ... from top to bottom, then left to right.)
*#10  AXP2101  [QFN-40_L5.0-W5.0-P0.40-TL-EP3.4]
*#11  S2B-PH-K-S-GW  [CONN-TH_S2B-PH-K-S-GW]

### Nets

Not connected (* = marked no-connect by the designer): *#10 1(CHGLED) 2(VREF) 3(GND) 4(FB3) 5(LX3) 6(VIN3) 7(VIN4) 8(LX4) 9(FB4) 10(CPULDOS) 11(DLDO2/DC4SW) 12(BLDO1) 13(BLDOIN) 14(BLDO2) 15(ALDO4) 16(ALDO3) 17(ALDOIN) 18(ALDO1) 19(ALDO2) 20(DLDO1/DC1SW) 21(FB1) 22(LX1) 23(VIN1) 24(VIN2) 25(LX2) 26(FB2) 27(VBACKUP) 28(VRTC) 29(PWROK) 30(PWRON) 31(TS) 32(GPIO1/FB5/RTC/LDO2) 33(BAT) 34(VSYS) 35(SW) 36(VMID) 37(VBUS) 38(IRQ) 39(SDA) 40(SCK) 41(EP); *#11 1 2

### Library data of the parts
*#10 = AXP2101: Manufacturer: x-powers(芯智汇); ki_keywords: Microcontroller Units (MCUs/MPUs/SOCs); Footprint: easyeda2kicad:QFN-40_L5.0-W5.0-P0.40-TL-EP3.4; Supplier: https://www.lcsc.com/datasheet/C3036461.pdf; MPN: AXP2101; LCSC Part: C3036461; Value: AXP2101
*#11 = S2B-PH-K-S-GW: Manufacturer: JST; ki_keywords: Wire To Board / Wire To Wire Connector; Footprint: easyeda2kicad:CONN-TH_S2B-PH-K-S-GW; Supplier: https://lcsc.com/product-detail/PH-Connectors_JST_S2B-PH-K-S-GW_PHsocket-1-2P-Curved-needle-pitch2mm_C157932.html; MPN: S2B-PH-K-S-GW; LCSC Part: C157932; Value: S2B-PH-K-S-GW